# Altium schematic sheet Top_Section.SchDoc
size A4; SheetNumber: 1; SheetTotal: 3
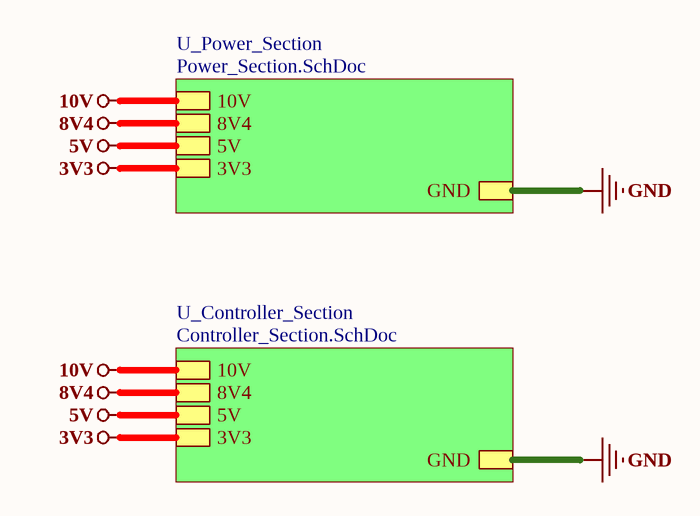
[diagram p0: Top_Section.SchDoc]

## Sub-sheets
U_Controller_Section = Controller_Section.SchDoc: 8V4, GND, 10V, 5V, 3V3
U_Power_Section = Power_Section.SchDoc: 8V4, GND, 10V, 5V, 3V3

## Nets
3V3: sheet U_Power_Section/3V3, sheet U_Controller_Section/3V3
5V: sheet U_Power_Section/5V, sheet U_Controller_Section/5V
8V4: sheet U_Power_Section/8V4, sheet U_Controller_Section/8V4
10V: sheet U_Power_Section/10V, sheet U_Controller_Section/10V
GND: sheet U_Power_Section/GND, sheet U_Controller_Section/GND

## Notes on the sheet
- File:
- Title:
- Date:
- Page
- Num:
- Total:
- Drawn By: Huzaifa Ali